# Altium schematic sheet Power_Sheet.SchDoc
size 420 x 297 mm; SheetNumber: 2; SheetTotal: 4
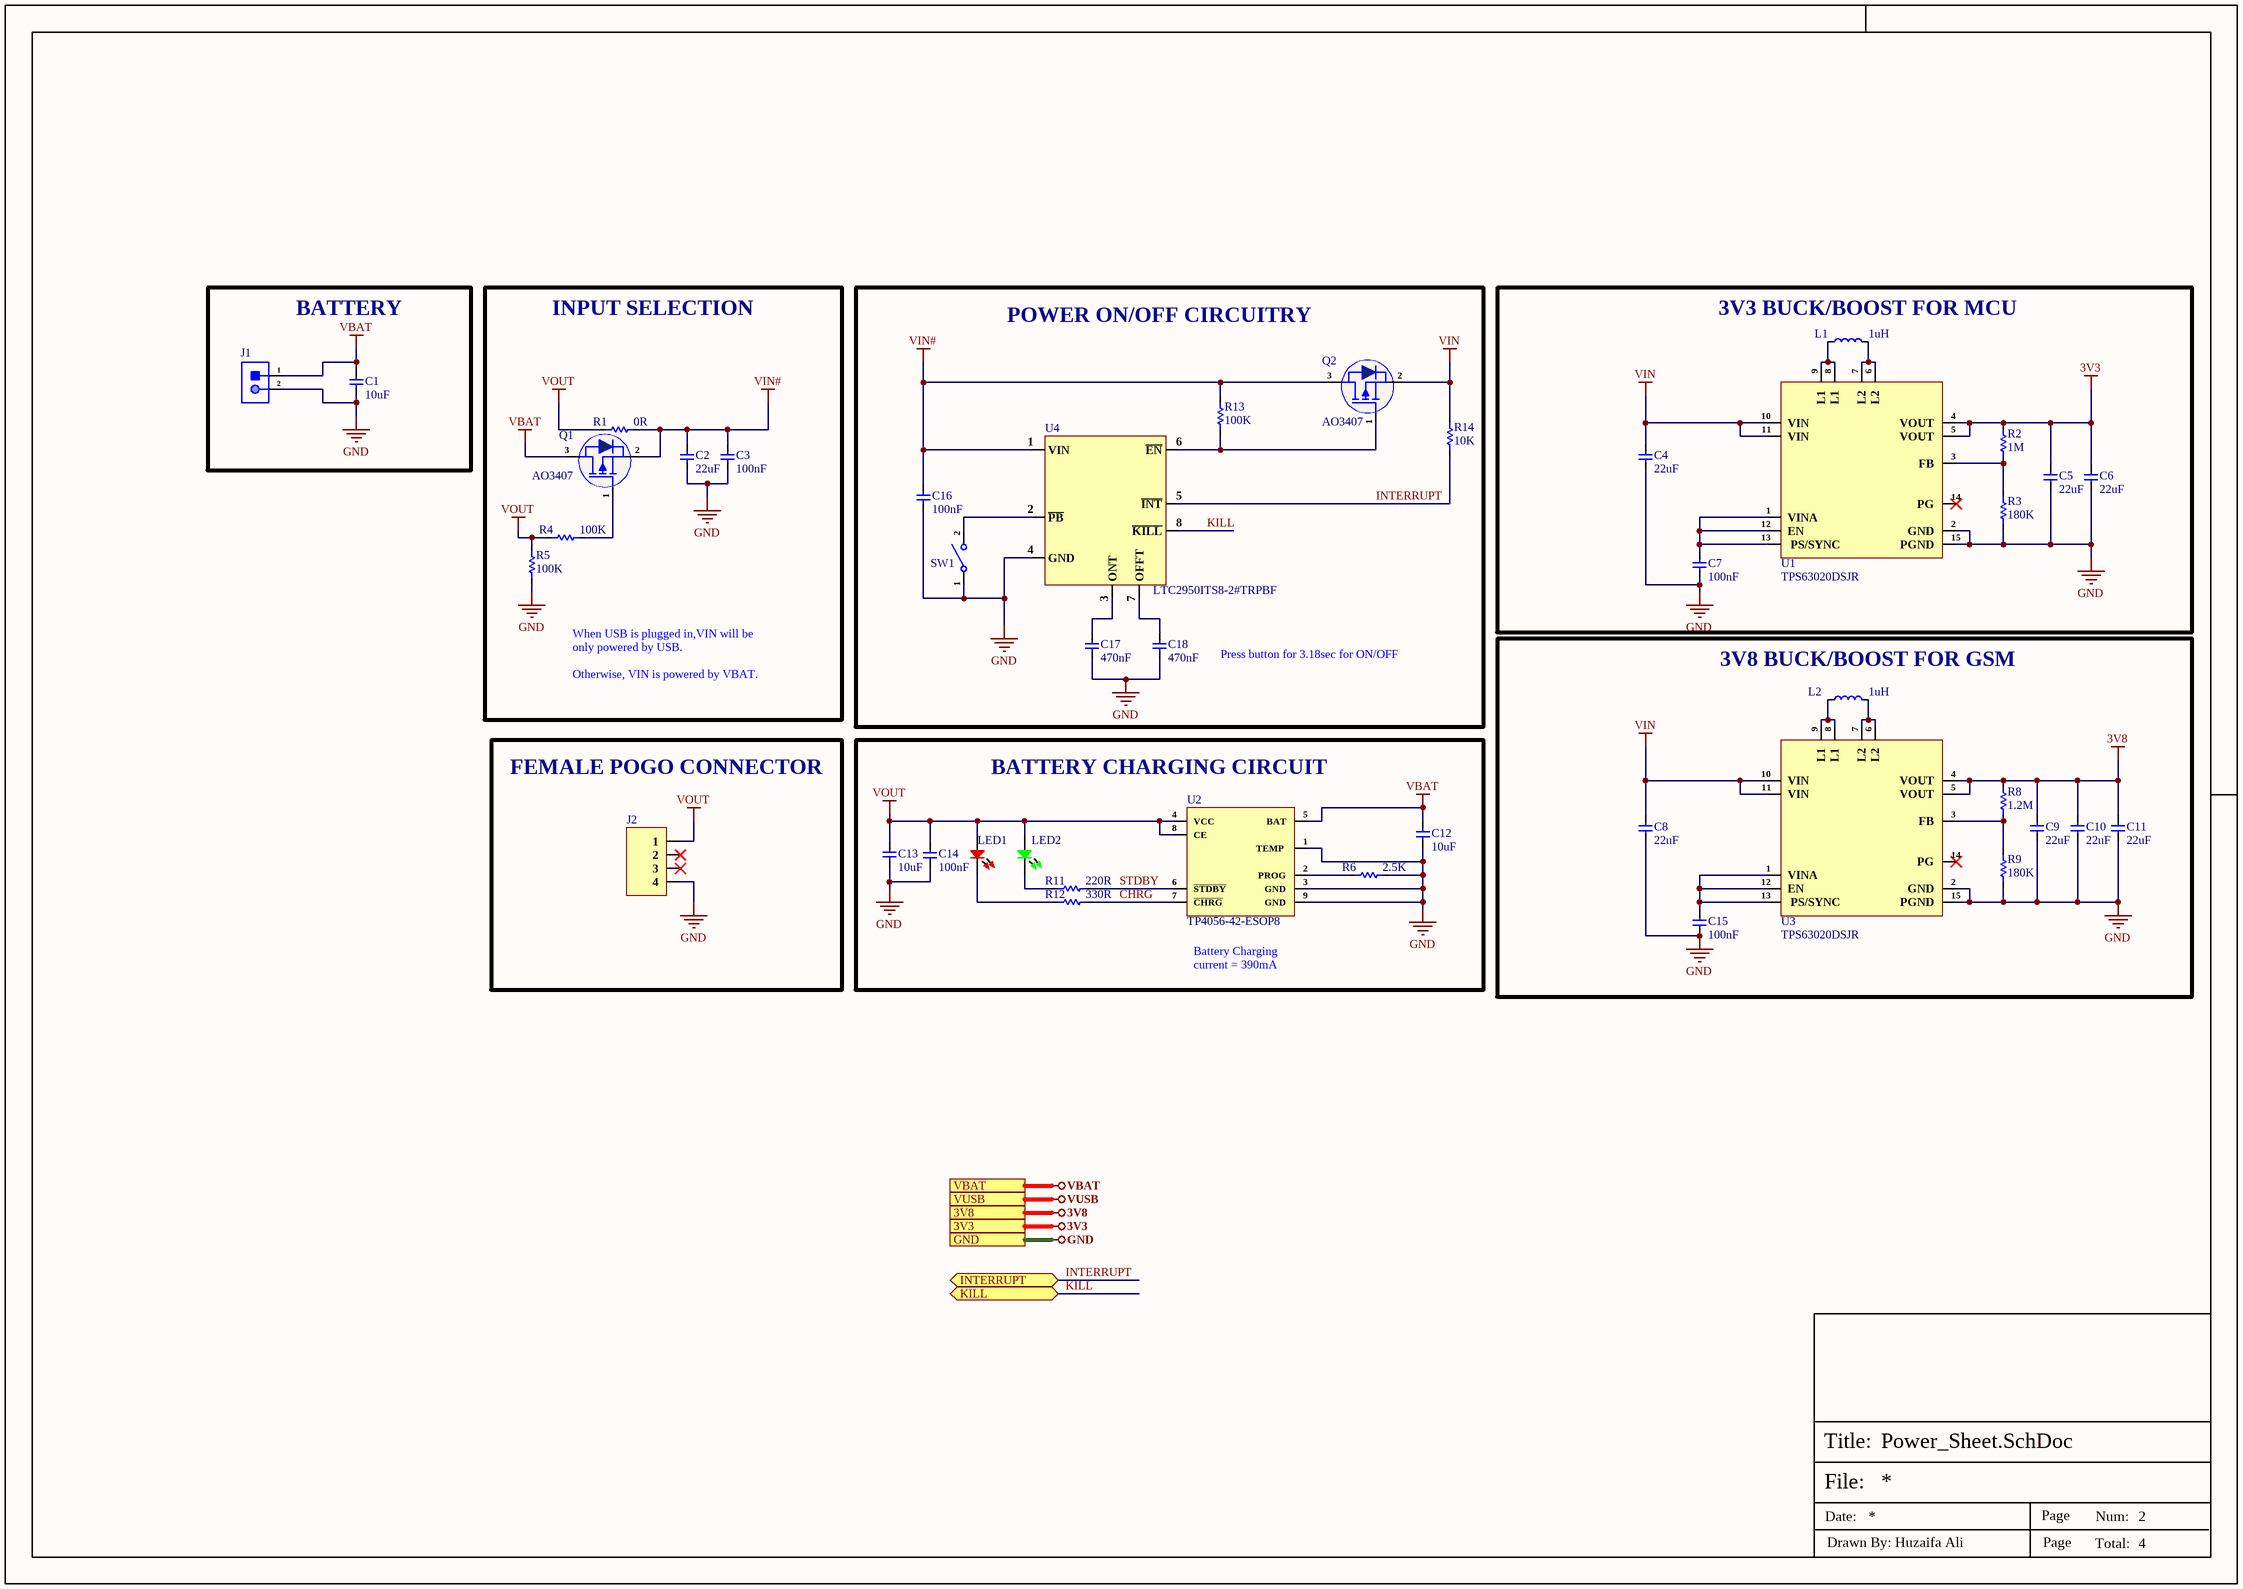
[diagram p0: Power_Sheet.SchDoc]

## Parts
C1  10uF  [Cap-0402]
C2  22uF  [Cap-0603]
C3  100nF  [CAP-0201]
C4  22uF  [Cap-0603]
C5  22uF  [Cap-0603]
C6  22uF  [Cap-0603]
C7  100nF  [CAP-0201]
C8  22uF  [Cap-0603]
C9  22uF  [Cap-0603]
C10  22uF  [Cap-0603]
C11  22uF  [Cap-0603]
C12  10uF  [Cap-0402]
C13  10uF  [Cap-0402]
C14  100nF  [CAP-0201]
C15  100nF  [CAP-0201]
C16  100nF  [CAP-0201]
C17  470nF  [Cap-0402]
C18  470nF  [Cap-0402]
J1  2 Test Pad  [2 Test Pad]  (value not drawn)
J2  YZT0675-20048-04025-01  [YZT0675-20048-04025-01]  (value not drawn)
L1  1uH  [WPN252012H1R0MT_]
L2  1uH  [PSPMAA0412-1R0M-ANP_]
LED1  RED  [LED-0603]  (value not drawn)
LED2  Emerald  [LED-0603]  (value not drawn)
Q1  AO3407  [SOT-23]
Q2  AO3407  [SOT-23]
R1  0R  [RES-2512]
R2  1M  [Res-0402]
R3  180K  [Res-0402]
R4  100K  [Res-0201]
R5  100K  [Res-0201]
R6  2.5K  [Res-0603]
R8  1.2M  [Res-0402]
R9  180K  [Res-0402]
R11  220R  [Res-0201]
R12  330R  [Res-0201]
R13  100K  [Res-0201]
R14  10K  [Res-0201]
SW1  TS-1185EC-C-D-B  [TS-1185EC-C-D-B_]  (value not drawn)
U1  TPS63020DSJR  [14-VSON (4x3)]
U2  TP4056-42-ESOP8  [ESOP-8]
U3  TPS63020DSJR  [14-VSON (4x3)]
U4  LTC2950ITS8-2#TRPBF  [TSOT-23-8]

## Blocks framed on the sheet
BATTERY: C1 J1
INPUT SELECTION: C2 C3 Q1 R1 R4 R5
POWER ON/OFF CIRCUITRY: C16-C18 Q2 R13 R14 SW1 U4
3V3 BUCK/BOOST FOR MCU: C4-C7 L1 R2 R3 U1
3V8 BUCK/BOOST FOR GSM: C8-C11 C15 L2 R8 R9 U3
FEMALE POGO CONNECTOR: J2
BATTERY CHARGING CIRCUIT: C12-C14 LED1 LED2 R6 R11 R12 U2

## Ports
3V3, 3V8, GND, INTERRUPT (bidir), KILL (bidir), VBAT, VUSB

## Nets
3V3: C5.2 C6.2 R2.2 U1.4(VOUT) U1.5(VOUT) ; port 3V3
3V8: C9.2 C10.2 C11.2 R8.2 U3.4(VOUT) U3.5(VOUT) ; port 3V8
GND: C1.2 C2.1 C3.1 C4.1 C5.1 C6.1 C7.1 C8.1 C9.1 C10.1 C11.1 C12.2 C13.2 C14.1 C15.1 C16.1 C17.1 C18.1 J1.2 J2.4 R3.1 R5.1 R6.2 R9.1 SW1.1 U1.2(GND) U1.15(PGND) U2.1(TEMP) U2.3(GND) U2.9(GND) U3.2(GND) U3.15(PGND) U4.4(GND) ; port GND
VBAT: C1.1 C12.1 J1.1 Q1.3(D) U2.5(BAT) ; port VBAT
VIN: C4.2 C8.2 Q2.2(S) R14.2 U1.10(VIN) U1.11(VIN) U3.10(VIN) U3.11(VIN)
VIN#: C2.2 C3.2 C16.2 Q1.2(S) Q2.3(D) R1.2 R13.2 U4.1(VIN)
VOUT: C13.1 C14.2 J2.1 LED1.1 LED2.1 R1.1 R4.1 R5.2 U2.4(VCC) U2.8(CE)
VUSB: port VUSB
CHRG: R12.2 U2.7(~{CHRG})
INTERRUPT: R14.1 U4.5(~{INT}) ; port INTERRUPT
KILL: U4.8(~{KILL}) ; port KILL
STDBY: R11.2 U2.6(~{STDBY})
NetC7_2: C7.2 U1.1(VINA) U1.12(EN) U1.13(PS/SYNC)
NetC15_2: C15.2 U3.1(VINA) U3.12(EN) U3.13(PS/SYNC)
NetC17_2: C17.2 U4.3(ONT)
NetC18_2: C18.2 U4.7(OFFT)
NetL1_1: L1.1 U1.8(L1) U1.9(L1)
NetL1_2: L1.2 U1.6(L2) U1.7(L2)
NetL2_1: L2.1 U3.8(L1) U3.9(L1)
NetL2_2: L2.2 U3.6(L2) U3.7(L2)
NetLED1_2: LED1.2 R12.1
NetLED2_2: LED2.2 R11.1
NetQ1_1: Q1.1(G) R4.2
NetQ2_1: Q2.1(G) R13.1 U4.6(~{EN})
NetR2_1: R2.1 R3.2 U1.3(FB)
NetR6_1: R6.1 U2.2(PROG)
NetR8_1: R8.1 R9.2 U3.3(FB)
NetSW1_2: SW1.2 U4.2(~{PB})

Not connected (* = marked no-connect by the designer): J2 2* 3*; U1 14(PG)*; U3 14(PG)*

## Notes on the sheet
- Press button for 3.18sec for ON/OFF
- When USB is plugged in,VIN will be only powered by USB.
  Otherwise, VIN is powered by VBAT.
- (near U2) Battery Charging current = 390mA
- File:
- Title:
- Date:
- Page
- Num:
- Total:
- Drawn By: Huzaifa Ali

## Library data of the parts
C1 C12 C13 = CL05A106MP5NUNC: CAP CER 10UF 10V X5R 0402; Manufacturer: Samsung; Tolerance: 20%; Item Type: Capacitor; Supplier 1: Avnet; Manufacturer Part Number: CL05A106MP5NUNC; RoHS: Yes; Category: Ceramic Capacitors; Stock 1: 1729850; Pricing 1: 10000=0.02537 (USD); Mount: Surface Mount; Case/Package: 0402; Case Code (Metric): 1005; Case Code (Imperial): 0402; Contact Plating: Tin; Min Operating Temperature: -55°C; Max Operating Temperature: 85°C; Package Quantity: 1; Packaging: Tape and Reel; Capacitance: 10uF; Voltage Rating: 10V; Dielectric: X5R; Termination: Wraparound; Series: CL; Construction: Flat; Length: 1mm; Width: 0.02inch; Thickness: 0.028inch; Depth: 0.5mm; Radiation Hardening: No; Lead Free: Lead Free; RoHS Compliant: Yes; ComponentLink1URL: https://datasheet.ciiva.com/25721/cl05a106mp5nunc-25721584.pdf?src-supplier=Digi-Key; ComponentLink1Description: https://datasheet.ciiva.com/25721/cl05a106mp5nunc-25721584.pdf?src-supplier=Digi-Key; ComponentLink2URL: https://datasheet.ciiva.com/26838/getdatasheetpartid-745310-26838170.pdf?src-supplier=Verical; ComponentLink2Description: https://datasheet.ciiva.com/26838/getdatasheetpartid-745310-26838170.pdf?src-supplier=Verical; Supplier Part Number 1: CL05A106MP5NUNC; LCSC Part Number: C315248
C2 C4-C6 C8-C11 = CC0603MRX5R6BB226: CAP CER 22UF 10V X5R 0603; Manufacturer: Yageo; Tolerance: 20%; Item Type: Capacitor; Supplier 1: Digi-Key; Manufacturer Part Number: CC0603MRX5R6BB226; RoHS: Yes; Category: Ceramic Capacitors; Stock 1: 19628; Pricing 1: 1=0.68000, 10=0.48000, 50=0.36300, 100=0.31610, 500=0.23416, 1000=0.19903 (USD); Mount: Surface Mount; Case/Package: 0603; Case Code (Metric): 1608; Case Code (Imperial): 0603; Weight: 7.1E-05oz; Min Operating Temperature: -55°C; Max Operating Temperature: 85°C; Packaging: Tape and Reel; Capacitance: 22uF; Voltage Rating: 10V; Dielectric: X5R; Termination: SMD/SMT; Voltage Rating (DC): 10V; Package Quantity: 4000; Length: 0.063inch; Width: 0.8mm; Height: 0.8mm; Thickness: 0.035inch; Lead Free: Lead Free; Halogen Free: Halogen Free; RoHS Compliant: Yes; ComponentLink1URL: http://www.mouser.com/ds/2/447/Yageo_UPY-GP_NP0_16V-to-50V_9-358835.pdf?src-supplier=Mouser; ComponentLink1Description: http://www.mouser.com/ds/2/447/Yageo_UPY-GP_NP0_16V-to-50V_9-358835.pdf?src-supplier=Mouser; ComponentLink2URL: http://www.yageo.com/documents/recent/UPY-GPHC_X5R_4V-to-50V_25.pdf?src-supplier=Digi-Key; ComponentLink2Description: http://www.yageo.com/documents/recent/UPY-GPHC_X5R_4V-to-50V_25.pdf?src-supplier=Digi-Key; Supplier Part Number 1: 311-1819-1-ND; LCSC Part Number: C109447
C3 C7 C14-C16 = CC0201KRX5R6BB104: CAP CER 0.1UF 10V X5R 0201; Manufacturer: Yageo; Tolerance: 10%; Supplier 1: Mouser; Manufacturer Part Number: CC0201KRX5R6BB104; RoHS: Yes; Category: Ceramic Capacitors; Stock 1: 824403; Pricing 1: 1=0.10000, 10=0.02400, 50=0.02400, 100=0.01900, 1000=0.01100, 10000=0.00900 (USD); Mount: Surface Mount; Case/Package: 0201; Case Code (Imperial): 0201; Case Code (Metric): 0603; Weight: 6E-06oz; Min Operating Temperature: -55°C; Max Operating Temperature: 85°C; Capacitance: 100nF; Dielectric: X5R; Voltage Rating (DC): 10V; Packaging: Tape and Reel; Termination: SMD/SMT; Resistor Type: Ceramic; Voltage Rating: 10V; Series: CC; Construction: Flat; Length: 0.6mm; Width: 0.012inch; Height: 0.3mm; Thickness: 0.013inch; Depth: 0.3mm; Radiation Hardening: No; Lead Free: Lead Free; Halogen Free: Halogen Free; RoHS Compliant: Yes; ComponentLink1URL: https://datasheet.ciiva.com/11587/upy-gphc-x5r-4v-to-50v-12-11587190.pdf?src-supplier=Avnet; ComponentLink1Description: https://datasheet.ciiva.com/11587/upy-gphc-x5r-4v-to-50v-12-11587190.pdf?src-supplier=Avnet; Supplier Part Number 1: 603-CC201KRX5R6BB104; LCSC Part Number: C190183
C17 C18 = CC0402KRX5R7BB474: CAP CER 0.47UF 16V X5R 0402; Manufacturer: Yageo; Tolerance: 10%; Item Type: Capacitor; Supplier 1: Future Electronics; Manufacturer Part Number: CC0402KRX5R7BB474; RoHS: Yes; Category: Ceramic Capacitors; Stock 1: 10000; Pricing 1: 10000=0.01840, 20000=0.01800, 40000=0.01760, 50000=0.01750, 150000=0.01670 (USD); Mount: Surface Mount; Case/Package: 0402; Min Operating Temperature: -55°C; Max Operating Temperature: 85°C; Capacitance: 470nF; Packaging: Tape and Reel; Voltage Rating: 16V; Voltage Rating (DC): 16V; Length: 0.039inch; Width: 0.02inch; Thickness: 0.022inch; Lead Free: Lead Free; Halogen Free: Halogen Free; RoHS Compliant: Yes; ComponentLink1URL: http://www.yageo.com/documents/recent/UPY-GPHC_X5R_4V-to-50V_25.pdf?src-supplier=Digi-Key; ComponentLink1Description: http://www.yageo.com/documents/recent/UPY-GPHC_X5R_4V-to-50V_25.pdf?src-supplier=Digi-Key; ComponentLink2URL: http://www.yageo.com/exep/pages/download/literatures/ProductSelectionGuide%202014_Final_2.pdf?src-supplier=Digi-Key; ComponentLink2Description: http://www.yageo.com/exep/pages/download/literatures/ProductSelectionGuide%202014_Final_2.pdf?src-supplier=Digi-Key; Supplier Part Number 1: 1070400; LCSC Part Number: C527010
J1 = 2 Test Pad: Wire Connecting Pad; Item Type: Test Point; Manufacturer Part Number: 2 Test Pad
J2 = YZT0675-20048-04025-01: Brass 2.5mm -20℃~+70℃ 4.8mm 四PINBit 50mΩ 10000次 Gold - Thimble/Copper Rod/Test Ring ROHS; Manufacturer: Xinyangze; Item Type: Pogo Pin Connector; Manufacturer Part Number: YZT0675-20048-04025-01; Package: Custom; LCSC Part Number: C5126846; ComponentLink1Description: LCSC; ComponentLink1URL: https://www.lcsc.com/product-detail/Thimble-Copper-Rod-Test-Ring_Xinyangze-YZT0675-20048-04025-01_C5126846.html
L1 = WPN252012H1R0MT: FIXED IND 1UH 3A 54 MOHM SMD; Manufacturer: Sunlord; Item Type: Inductor; Supplier 1: Digi-Key; Manufacturer Part Number: WPN252012H1R0MT; RoHS: Yes; Category: Fixed Inductors; Stock 1: 4813; Pricing 1: 1=0.46000, 10=0.40400, 25=0.37520, 50=0.31760, 100=0.28880, 250=0.27144, 500=0.24256, 1000=0.19635 (USD); Supplier Part Number 1: 3442-WPN252012H1R0MTCT-ND; LCSC Part Number: C98348; ComponentLink1Description: LCSC; ComponentLink1URL: https://www.lcsc.com/product-detail/Power-Inductors_Sunlord-WPN252012H1R0MT_C98348.html
L2 = PSPMAA0412-1R0M-ANP: 4.5A 1uH ±20% 70mΩ 5.5A SMD,4.2x4.4x1.2mm Power Inductors ROHS; Manufacturer: PROD Tech; ComponentLink1Description: LCSC; ComponentLink1URL: https://lcsc.com/product-detail/Power-Inductors_PROD-Tech-PSPMAA0412-1R0M-ANP_C705331.html; Manufacturer Part Number: PSPMAA0412-1R0M-ANP; Footprint: Custom; LCSC Part Number: C705331
LED1 = 19-21/R7C-AK1L2BY/3T: Red 632nm LED Indication - Discrete 2.05V 0603 (1608 Metric); Manufacturer: Everlight Elec; Manufacturer Part Number: 19-21/R7C-AK1L2BY/3T; Package: 0603; LCSC Part Number: C1322287; Item Type: LED; ComponentLink1Description: LCSC; ComponentLink1URL: https://www.lcsc.com/product-detail/Light-Emitting-Diodes-LED_Everlight-Elec-19-21-R7C-AK1L2BY-3T_C1322287.html
LED2 = NCD0603G2: Emerald 0603 Light Emitting Diodes (LED) ROHS; Manufacturer: Foshan NationStar Optoelectronics; Manufacturer Part Number: NCD0603G2; Package: 0603; LCSC Part Number: C87326; Item Type: LED; ComponentLink1Description: LCSC; ComponentLink1URL: https://www.lcsc.com/product-detail/Light-Emitting-Diodes-LED_Foshan-NationStar-Optoelectronics-NCD0603G2_C87326.html
Q1 Q2 = AO3407: 30V 4.1A 60mΩ@10V,4.1A 350mW 3V@250uA P Channel SOT-23 MOSFETs ROHS; Manufacturer: Guangdong Hottech; Item Type: Mosfet; Manufacturer Part Number: AO3407; Package: SOT-23; LCSC Part Number: C181093; ComponentLink1Description: LCSC; ComponentLink1URL: https://www.lcsc.com/product-detail/MOSFETs_Guangdong-Hottech-AO3407_C181093.html
R1 = FRP2512F0000TS: 2W Thick Film Resistors ±200ppm/℃ ±1% 0Ω 2512 Chip Resistor - Surface Mount ROHS; Manufacturer: FOJAN; Manufacturer Part Number: FRP2512F0000TS; Package: 2512; LCSC Part Number: C5204052; Item Type: Resistor; ComponentLink1Description: LCSC; ComponentLink1URL: https://www.lcsc.com/product-detail/Chip-Resistor-Surface-Mount_FOJAN-FRP2512F0000TS_C5204052.html
R2 = RTT021004BTH: 62.5mW Thick Film Resistors ±100ppm/℃ ±0.1% 1MΩ 0402 Chip Resistor - Surface Mount ROHS; Manufacturer: RALEC; ComponentLink1Description: LCSC; ComponentLink1URL: https://www.lcsc.com/product-detail/Chip-Resistor-Surface-Mount_RALEC-RTT021004BTH_C525710.html; Manufacturer Part Number: RTT021004BTH; Package: 0402; LCSC Part Number: C525710; Item Type: Resistor
R3 R9 = RT0402BRD07180KL: RES 180K OHM 0.1% 1/16W 0402; Manufacturer: Yageo; Value: 180kR; Max Power Dissipation: 63mW; Temperature Coefficient: 25ppm/°C; Item Type: Resistor; Supplier: Mouser; Supplier Part Number: 603-RT0402BRD07180KL; Manufacturer Part Number: RT0402BRD07180KL; RoHS: Yes; Category: Chip SMD Resistors; Stock: 23360; Pricing: 1=0.44, 10=0.324, 50=0.324, 100=0.129, 1000=0.064, 10000=0.051 (USD); Case/Package: 0402; Min Operating Temperature: -55°C; Max Operating Temperature: 155°C; Packaging: Tape and Reel; Tolerance: 0.1%; Number of Terminations: 2; Series: RT; RoHS Compliant: Yes; ComponentLink1URL: http://www.yageo.com/documents/recent/PYu-RT_1-to-0.01_RoHS_L_9.pdf?src-supplier=Digi-Key; ComponentLink1Description: http://www.yageo.com/documents/recent/PYu-RT_1-to-0.01_RoHS_L_9.pdf?src-supplier=Digi-Key; LCSC Part Number: C852573
R4 R5 R13 = RC0201FR-07100KL: RES 100K OHM 1% 1/20W 0201; Manufacturer: Yageo; Resistance: 100kR; Temperature Coefficient: 200ppm/°C; Power Rating: 50mW; Voltage Rating: 25V; Supplier 1: Digi-Key; Manufacturer Part Number: RC0201FR-07100KL; RoHS: Yes; Category: Chip SMD Resistors; Stock 1: 6740592; Pricing 1: 1=0.10000, 10=0.03900, 100=0.01570, 1000=0.00705, 2500=0.00612, 5000=0.00506 (USD); Case/Package: 0201; Number of Pins: 2; Contact Plating: Tin,Matte; Case Code (Imperial): 0201; Case Code (Metric): 0603; Size Code: 0201; Min Operating Temperature: -55°C; Max Operating Temperature: 125°C; Tolerance: 1%; Resistor Type: Thick Film; Packaging: Tape and Reel; Package Quantity: 10000; Termination: SMD/SMT; Number of Terminations: 2; Max Power Dissipation: 50mW; Voltage Rating (DC): 25V; Features: Moisture Resistant; Series: RC; Resistance Tolerance: 1%; Construction: Rectangular; Length: 0.024inch; Width: 0.012inch; Height: 0.01inch; Depth: 0.3mm; REACH SVHC: No SVHC; Military Standard: Not; Lead Free: Lead Free; RoHS Compliant: Yes; ComponentLink1URL: https://datasheet.ciiva.com/7660/1421516-7660806.pdf?src-supplier=Element14; ComponentLink1Description: https://datasheet.ciiva.com/7660/1421516-7660806.pdf?src-supplier=Element14; ComponentLink2URL: https://datasheet.ciiva.com/22698/1563626-22698495.pdf?src-supplier=Element14; ComponentLink2Description: https://datasheet.ciiva.com/22698/1563626-22698495.pdf?src-supplier=Element14; ComponentLink3URL: https://datasheet.ciiva.com/46391/1421516-46391338.pdf?src-supplier=Element14; ComponentLink3Description: https://datasheet.ciiva.com/46391/1421516-46391338.pdf?src-supplier=Element14; ComponentLink4URL: https://datasheet.ciiva.com/2493/pyu-r-int-thick-7-2493770.pdf?src-supplier=Digi-Key; ComponentLink4Description: https://datasheet.ciiva.com/2493/pyu-r-int-thick-7-2493770.pdf?src-supplier=Digi-Key; ComponentLink5URL: https://datasheet.ciiva.com/2493/pyu-r-int-thick-7-2493771.pdf?src-supplier=Digi-Key; ComponentLink5Description: https://datasheet.ciiva.com/2493/pyu-r-int-thick-7-2493771.pdf?src-supplier=Digi-Key; ComponentLink6URL: https://datasheet.ciiva.com/2493/pyu-r-int-thick-7-2493769.pdf?src-supplier=Digi-Key; ComponentLink6Description: https://datasheet.ciiva.com/2493/pyu-r-int-thick-7-2493769.pdf?src-supplier=Digi-Key; ComponentLink7URL: https://datasheet.ciiva.com/26829/getdatasheetpartid-420441-26829850.pdf?src-supplier=Verical; ComponentLink7Description: https://datasheet.ciiva.com/26829/getdatasheetpartid-420441-26829850.pdf?src-supplier=Verical; Supplier Part Number 1: 311-100KMCT-ND; LCSC Part Number: C106224
R6 = AR03BTCX2501N: ±0.1% 2.5kΩ 0603 Chip Resistor - Surface Mount ROHS; Manufacturer: Viking Tech; Manufacturer Part Number: AR03BTCX2501N; Package: 0603; LCSC Part Number: C3013546; Item Type: Resistor; ComponentLink1Description: LCSC; ComponentLink1URL: https://www.lcsc.com/product-detail/Chip-Resistor-Surface-Mount_Viking-Tech-AR03BTCX2501N_C3013546.html
R8 = AC0402FR-071M2L: RES SMD 1.2M OHM 1% 1/16W 0402; Manufacturer: Yageo; Power Rating: 62.5mW; Value: 1.2MR; Voltage Rating: 50V; Max Power Dissipation: 63mW; Temperature Coefficient: 100ppm/°C; Item Type: Resistor; Supplier: Avnet; Supplier Part Number: AC0402FR-071M2L; Manufacturer Part Number: AC0402FR-071M2L; RoHS: Yes; Category: Chip SMD Resistors; Stock: 1670000; Pricing: 10000=0.00115 (USD); Case/Package: 0402; Case Code (Imperial): 0402; Case Code (Metric): 1005; Min Operating Temperature: -55°C; Max Operating Temperature: 155°C; Packaging: Tape and Reel; Tolerance: 1%; Number of Terminations: 2; Termination: SMD/SMT; Features: Moisture Resistant,Automotive AEC-Q200; Series: AC; Length: 0.039inch; Width: 0.5mm; Height: 0.015inch; RoHS Compliant: Yes; ComponentLink1URL: http://www.mouser.com/ds/2/447/yageodocoutput-1111992.pdf?src-supplier=Mouser; ComponentLink1Description: http://www.mouser.com/ds/2/447/yageodocoutput-1111992.pdf?src-supplier=Mouser; ComponentLink2URL: http://www.yageo.com/NewPortal/yageodocoutput?fileName=/pdf/R-Chip/PYu-AC_51_RoHS_L_6.pdf&src-supplier=Digi-Key; ComponentLink2Description: http://www.yageo.com/NewPortal/yageodocoutput?fileName=/pdf/R-Chip/PYu-AC_51_RoHS_L_6.pdf&src-supplier=Digi-Key; LCSC Part Number: C226867
R11 = RC0201FR-07220RL: RES 220 OHM 1% 1/20W 0201; Manufacturer: Yageo; Temperature Coefficient: 200ppm/°C; Power Rating: 50mW; Voltage Rating: 25V; Supplier 1: Digi-Key; Manufacturer Part Number: RC0201FR-07220RL; RoHS: Yes; Category: Chip SMD Resistors; Stock 1: 189347; Pricing 1: 1=0.10000, 10=0.03600, 100=0.01480, 1000=0.00665, 2500=0.00577, 5000=0.00477 (USD); Case/Package: 0201; Contact Plating: Tin,Matte; Case Code (Imperial): 0201; Case Code (Metric): 0603; Min Operating Temperature: -55°C; Max Operating Temperature: 125°C; Resistance: 220R; Tolerance: 1%; Resistor Type: Thick Film; Packaging: Tape and Reel; Features: Moisture Resistant; Max Power Dissipation: 50mW; Number of Terminations: 2; Termination: SMD/SMT; Length: 0.6mm; Width: 0.012inch; Height: 0.01inch; Depth: 0.3mm; Radiation Hardening: No; REACH SVHC: Unknown; Military Standard: Not; ComponentLink1URL: https://datasheet.ciiva.com/7672/1563626-7672213.pdf?src-supplier=Element14; ComponentLink1Description: https://datasheet.ciiva.com/7672/1563626-7672213.pdf?src-supplier=Element14; ComponentLink2URL: https://datasheet.ciiva.com/8886/pyu-rc0201-51-rohs-l-8-8886758.pdf?src-supplier=Avnet; ComponentLink2Description: https://datasheet.ciiva.com/8886/pyu-rc0201-51-rohs-l-8-8886758.pdf?src-supplier=Avnet; ComponentLink3URL: https://datasheet.ciiva.com/16855/pyu-rc0201-51-rohs-l-8-16855847.pdf?src-supplier=Avnet+Europe; ComponentLink3Description: https://datasheet.ciiva.com/16855/pyu-rc0201-51-rohs-l-8-16855847.pdf?src-supplier=Avnet+Europe; ComponentLink4URL: https://datasheet.ciiva.com/28393/pyu-rc0201-51-rohs-l-8-28393063.pdf?src-supplier=Avnet+Europe; ComponentLink4Description: https://datasheet.ciiva.com/28393/pyu-rc0201-51-rohs-l-8-28393063.pdf?src-supplier=Avnet+Europe; Supplier Part Number 1: YAG2509CT-ND; LCSC Part Number: C274342
R12 = RC0201DR-07330RL: RES 330 OHM 0.5% 1/20W 0201; Manufacturer: Yageo; Max Power Dissipation: 50mW; Temperature Coefficient: 200ppm/°C; Item Type: Resistor; Supplier 1: Digi-Key; Manufacturer Part Number: RC0201DR-07330RL; RoHS: Yes; Category: Chip SMD Resistors; Pricing 1: 10000=0.02267 (USD); Case/Package: 0201; Min Operating Temperature: -55°C; Max Operating Temperature: 125°C; Packaging: Tape and Reel; Value: 330R; Number of Terminations: 2; Tolerance: 0.5%; Features: Moisture Resistant; Series: RC; Length: 0.024inch; Width: 0.012inch; Height: 0.01inch; RoHS Compliant: Yes; ComponentLink1URL: http://www.yageo.com.tw/exep/pages/download/literatures/PYu-R_INT-thick_7.pdf?src-supplier=Digi-Key; ComponentLink1Description: http://www.yageo.com.tw/exep/pages/download/literatures/PYu-R_INT-thick_7.pdf?src-supplier=Digi-Key; Supplier Part Number 1: RC0201DR-07330RL-ND; LCSC Part Number: C851717
R14 = RC0201FR-0710KL: RES SMD 10K OHM 1% 1/20W 0201; Manufacturer: Yageo; Item Type: Resistor; Manufacturer Part Number: RC0201FR-0710KL; Package: 0201; ComponentLink7Description: LCSC; ComponentLink7URL: https://www.lcsc.com/product-detail/Chip-Resistor-Surface-Mount_YAGEO-RC0201FR-0710KL_C106225.html; LCSC Part Number: C106225
SW1 = TS-1185EC-C-D-B: 3mm 2mm Round Button 50mA Top3.65mm SPST 12V SMD Tactile Switches; Manufacturer: XKB; Manufacturer Part Number: TS-1185EC-C-D-B; Footprint: Custom; ComponentLink1Description: LCSC; ComponentLink1URL: https://lcsc.com/product-detail/Tactile-Switches_XKB-Connectivity-TS-1185EC-C-D-B_C318893.html; LCSC Part Number: C318893
U1 U3 = TPS63020DSJR: IC REG BUCK-BST ADJ 3.5A 14VSON; Manufacturer: Texas Instruments; Min Supply Voltage: 1.8V; Number of Outputs: 1; Output Voltage: 5.5V; Output Current: 3A; Efficiency: 96%; Switching Frequency: 2.4MHz; Min Output Voltage: 1.2V; Synchronous Rectifier: Yes; Quiescent Current: 50uA; Topology: Buck-Boost; Output Type: Adjustable; Output Configuration: Positive; Supplier: Mouser; Supplier Part Number: 595-TPS63020DSJR; Manufacturer Part Number: TPS63020DSJR; RoHS: Yes; Category: Voltage Regulators - Switching; Stock: 18181; Pricing: 1=2.8, 10=2.43, 50=2.43, 100=2.07, 1000=1.46, 10000=1.36 (USD); Mounting Technology: Surface Mount; Case/Package: VSON; Pins: 14; Min Operating Temperature: -40°C; Max Operating Temperature: 85°C; Package Quantity: 3000; Packaging: Tape and Reel; Min Input Voltage: 1.8V; Max Output current: 3A; Max Supply Voltage: 5.5V; Max Output Voltage: 5.5V; Operating Supply Voltage: 5.5V; Series: -; Supply Current: 50uA; Reach SVHC Compliant: No; Lead Free: Lead Free; RoHS Compliant: Yes; ComponentLink1URL: https://datasheet.ciiva.com/29733/tps63021-29733058.pdf?src-supplier=Digi-Key; ComponentLink1Description: https://datasheet.ciiva.com/29733/tps63021-29733058.pdf?src-supplier=Digi-Key; ComponentLink2URL: https://datasheet.ciiva.com/29733/tps63020-29733142.pdf?src-supplier=Digi-Key; ComponentLink2Description: https://datasheet.ciiva.com/29733/tps63020-29733142.pdf?src-supplier=Digi-Key; ComponentLink3URL: https://datasheet.ciiva.com/3221/tps63020-3221509.pdf?src-supplier=Avnet; ComponentLink3Description: https://datasheet.ciiva.com/3221/tps63020-3221509.pdf?src-supplier=Avnet; LCSC Part Number: C15483; Item Type: IC
U2 = TP4056-42-ESOP8: ESOP-8 Battery Management ICs ROHS; Manufacturer: TOPPOWER; Item Type: Mosfet; Manufacturer Part Number: TP4056-42-ESOP8; Package: ESOP-8; LCSC Part Number: C16581; ComponentLink1Description: LCSC; ComponentLink1URL: https://www.lcsc.com/product-detail/Battery-Management-ICs_TOPPOWER-Nanjing-Extension-Microelectronics-TP4056-42-ESOP8_C16581.html
U4 = LTC2950ITS8-2#TRPBF: IC Pb On/off Controller TSOT23-8; Manufacturer: Analog Devices / Linear Technology; Operating Supply Current: 6uA; Supplier 1: Mouser; Manufacturer Part Number: LTC2950ITS8-2#TRPBF; RoHS: Yes; Category: Integrated Circuits (ICs); Stock 1: 260; Pricing 1: 1=6.42, 10=5.8, 50=5.53, 100=4.8, 1000=3.76, 10000=3.62 (USD); Case/Package: SOT-23-8; Number of Pins: 8; Min Operating Temperature: -40°C; Max Operating Temperature: 85°C; Package Quantity: 2500; Packaging: Tape and Reel; Series: -; Length: 2.9mm; RoHS Compliant: Yes; ComponentLink1URL: https://datasheet.ciiva.com/1967/7377-1967658.pdf?src-supplier=Digi-Key; ComponentLink1Description: https://datasheet.ciiva.com/1967/7377-1967658.pdf?src-supplier=Digi-Key; Supplier Part Number 1: 584-C2950ITS8-2TRPBF; LCSC Part Number: C683746; Item Type: IC